# Altium schematic sheet Non_Prog_Logic.SchDoc
size A3; SheetNumber: 2; SheetTotal: 3
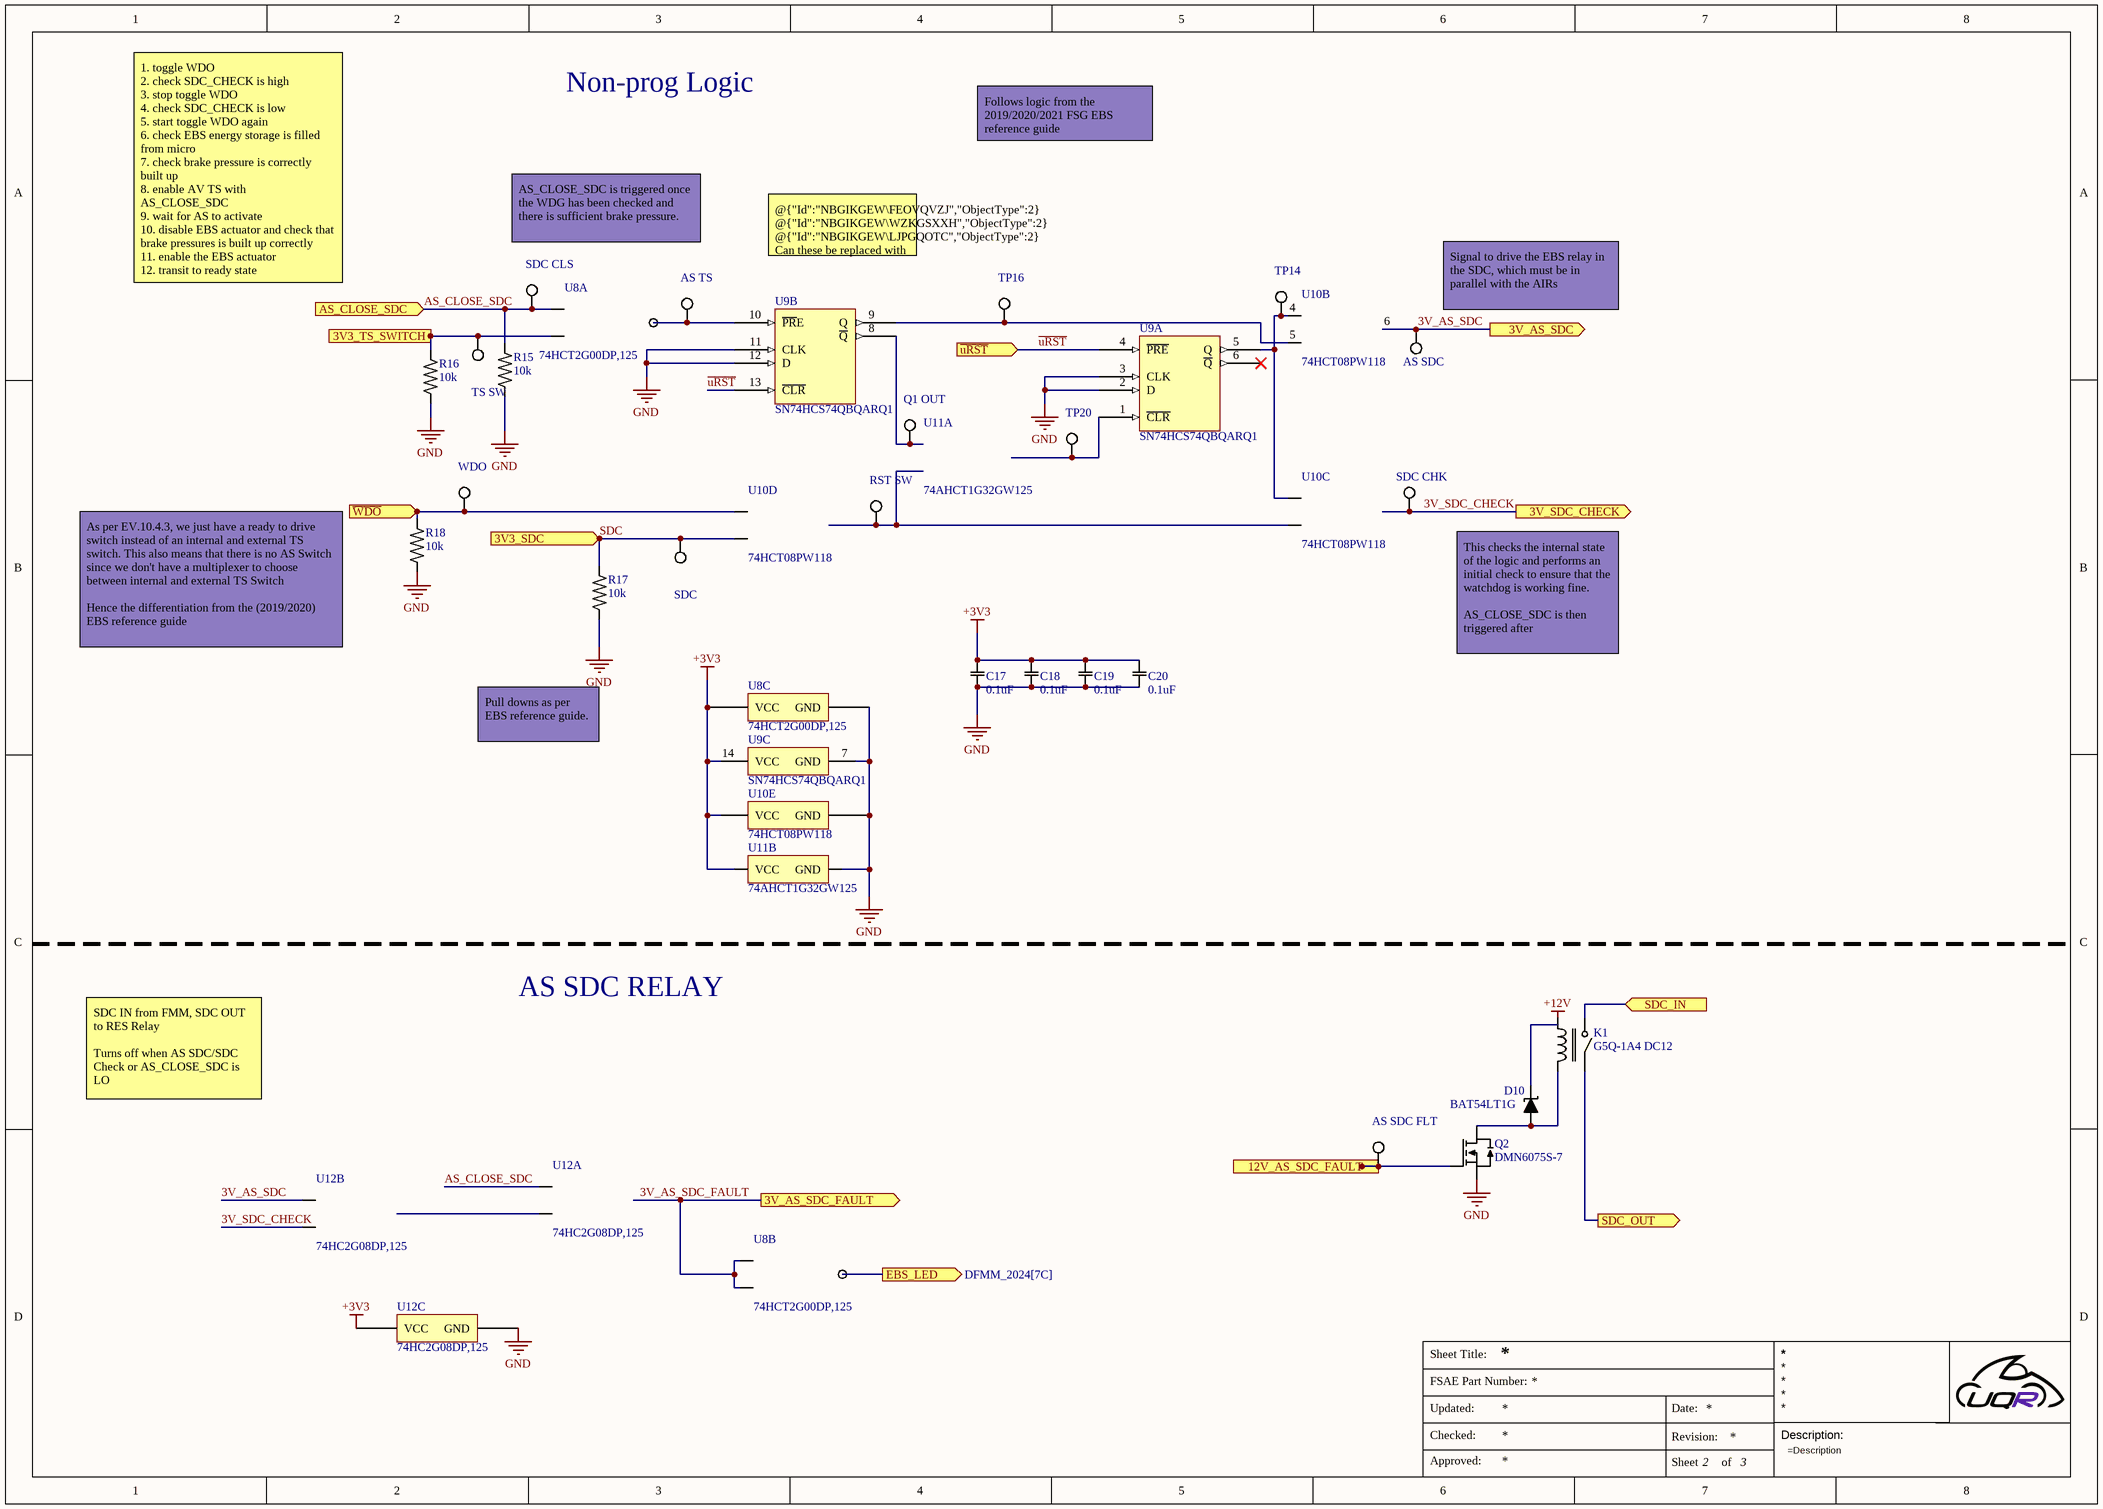
[diagram p0: Non_Prog_Logic.SchDoc]

## Parts
AS_SDC  5012  [KSTN-5012_V]  (value not drawn)
AS_SDC_FLT  5012  [KSTN-5012_V]  (value not drawn)
AS_TS  5012  [KSTN-5012_V]  (value not drawn)
C17  value 0.1uF  [CAPC1608X09M]  (hidden comment: CL10B104KB8NNWC)
C18  value 0.1uF  [CAPC1608X09M]  (hidden comment: CL10B104KB8NNWC)
C19  value 0.1uF  [CAPC1608X09M]  (hidden comment: CL10B104KB8NNWC)
C20  value 0.1uF  [CAPC1608X09M]  (hidden comment: CL10B104KB8NNWC)
D10  BAT54LT1G  [SOT95P237X111-3N]
K1  G5Q-1A4 DC12  [G5Q-1A4 DC12]
Q1_OUT  5012  [KSTN-5012_V]  (value not drawn)
Q2  DMN6075S-7  [SOT90P240X110-3N]
R15  value 10k  [RESC1608X06N]  (hidden comment: ESR03EZPJ103)
R16  value 10k  [RESC1608X06N]  (hidden comment: ESR03EZPJ103)
R17  value 10k  [RESC1608X06N]  (hidden comment: ESR03EZPJ103)
R18  value 10k  [RESC1608X06N]  (hidden comment: ESR03EZPJ103)
RST_SW  5012  [KSTN-5012_V]  (value not drawn)
SDC  5012  [KSTN-5012_V]  (value not drawn)
SDC_CHK  5012  [KSTN-5012_V]  (value not drawn)
SDC_CLS  5012  [KSTN-5012_V]  (value not drawn)
TP14  5012  [KSTN-5012_V]  (value not drawn)
TP16  5012  [KSTN-5012_V]  (value not drawn)
TP20  5012  [KSTN-5012_V]  (value not drawn)
TS_SW  5012  [KSTN-5012_V]  (value not drawn)
U8  74HCT2G00DP,125  [TSOP65P400X110-8N]  (parts A,B,C of 3)
U9  SN74HCS74QBQARQ1  [TSOP65P640X120-14N]  (parts A,B,C of 3)
U10  74HCT08PW118  [TSOP65P640X110-14N]  (parts B,C,D,E of 5)
U11  74AHCT1G32GW125  [TSOP65P210X110-6N]  (parts A,B of 2)
U12  74HC2G08DP,125  [TSOP65P490X108-8N]  (parts A,B,C of 3)
WDO  5012  [KSTN-5012_V]  (value not drawn)

## Ports
3V3_SDC (in, see DFMM_2024[7C], Microcontroller[3D]), 3V3_TS_SWITCH (in, see DFMM_2024[7B], Microcontroller[3D]), 3V_AS_SDC (out, see DFMM_2024[7B], Microcontroller[6A]), 3V_AS_SDC_FAULT (out, see DFMM_2024[7B], Microcontroller[1D]), 3V_SDC_CHECK (out, see DFMM_2024[7C], Microcontroller[6A]), 12V_AS_SDC_FAULT (in, see DFMM_2024[7B], Microcontroller[2D]), AS_CLOSE_SDC (in, see DFMM_2024[7B], Microcontroller[5B]), EBS_LED (out, see DFMM_2024[7C]), SDC_IN (in, see DFMM_2024[7C], Microcontroller[2D]), SDC_OUT (out, see DFMM_2024[7C]), ~{uRST} (in, see DFMM_2024[7B], Microcontroller[2A]), ~{WDO} (in, see DFMM_2024[7C], Microcontroller[2B])

## Nets
+3V3: C17.1 C18.1 C19.1 C20.1 U8.8(VCC) U9.14(VCC) U10.14(VCC) U11.5(VCC) U12.8(VCC)
+12V: D10.3(K)
GND: C17.2 C18.2 C19.2 C20.2 Q2.2(S) R15.2 R16.2 R17.2 R18.2 U8.4(GND) U9.2(D) U9.3(CLK) U9.7(GND) U9.11(CLK) U9.12(D) U10.7(GND) U11.3(GND) U12.4(GND)
3V3_TS_SWITCH: R16.1 TS_SW.1 U8.2(1B) ; port 3V3_TS_SWITCH
3V_AS_SDC: AS_SDC.1 U10.6(2Y) U12.5(2A) ; port 3V_AS_SDC
3V_AS_SDC_FAULT: U8.5(2A) U8.6(2B) U12.7(1Y) ; port 3V_AS_SDC_FAULT
3V_SDC_CHECK: SDC_CHK.1 U10.8(3Y) U12.6(2B) ; port 3V_SDC_CHECK
12V_AS_SDC_FAULT: AS_SDC_FLT.1 Q2.1(G) ; port 12V_AS_SDC_FAULT
~{uRST}: U9.4(~{PRE}) U9.13(~{CLR}) ; port ~{uRST}
~{WDO}: R18.1 U10.12(4A) WDO.1 ; port ~{WDO}
AS_CLOSE_SDC: R15.1 SDC_CLS.1 U8.1(1A) U12.1(1A) ; port AS_CLOSE_SDC
EBS_LED: U8.3(2Y) ; port EBS_LED
SDC: R17.1 SDC.1 U10.13(4B) ; port 3V3_SDC
SDC_IN: K1.3 ; port SDC_IN
SDC_OUT: K1.2 ; port SDC_OUT
NetAS_TS_1: AS_TS.1 U8.7(1Y) U9.10(~{PR}E)
NetD10_1: D10.1(A) K1.5 Q2.3(D)
NetQ1_OUT_1: Q1_OUT.1 U9.8(~{Q}) U11.2(A)
NetRST_SW_1: RST_SW.1 U10.10(3B) U10.11(4Y) U11.1(B)
NetTP14_1: TP14.1 U9.5(Q) U10.4(2A) U10.9(3A)
NetTP16_1: TP16.1 U9.9(Q) U10.5(2B)
NetTP20_1: TP20.1 U9.1(~{CLR}) U11.4(Y)
NetU12_2: U12.2(1B) U12.3(2Y)

Not connected (* = marked no-connect by the designer): K1 1; U9 6(~{Q})*

## Notes on the sheet
- Non-prog Logic
- Follows logic from the 2019/2020/2021 FSG EBS reference guide
- AS_CLOSE_SDC is triggered once the WDG has been checked and there is sufficient brake pressure.
- 1. toggle WDO
  2. check SDC_CHECK is high
  3. stop toggle WDO
  4. check SDC_CHECK is low
  5. start toggle WDO again
  6. check EBS energy storage is filled from micro
  7. check brake pressure is correctly built up
  8. enable AV TS with AS_CLOSE_SDC
  9. wait for AS to activate
  10. disable EBS actuator and check that brake pressures is built up correctly
  11. enable the EBS actuator
  12. transit to ready state
- @{"Id":"NBGIKGEW\FEOVQVZJ","ObjectType":2} @{"Id":"NBGIKGEW\WZKGSXXH","ObjectType":2} @{"Id":"NBGIKGEW\LJPGQOTC","ObjectType":2} Can these be replaced with latch?
- Signal to drive the EBS relay in the SDC, which must be in parallel with the AIRs
- As per EV.10.4.3, we just have a ready to drive switch instead of an internal and external TS switch. This also means that there is no AS Switch since we don't have a multiplexer to choose between internal and external TS Switch
  Hence the differentiation from the (2019/2020) EBS reference guide
- This checks the internal state of the logic and performs an initial check to ensure that the watchdog is working fine.
  AS_CLOSE_SDC is then triggered after
- Pull downs as per EBS reference guide.
- AS SDC RELAY
- SDC IN from FMM, SDC OUT to RES Relay
  Turns off when AS SDC/SDC Check or AS_CLOSE_SDC is LO
- Sheet Title:
- FSAE Part Number:
- Updated:
- Approved:
- Checked:
- Date:
- Revision:
- Description:
- Sheet
- of

## Library data of the parts
AS_SDC AS_SDC_FLT AS_TS Q1_OUT RST_SW SDC SDC_CHK SDC_CLS TP14 TP16 TP20 TS_SW WDO = CMP-008-000006-1: PC TEST POINT MULTIPURPOSE WHITE; Manufacturer: Keystone Electronics; SPN: 36-5012-ND; Supplier: Digi=Key; MPN: 5012; Link: https://www.digikey.com.au/en/products/detail/keystone-electronics/5012/255334
C17-C20 = CMP-001-00001-2: CAP CER 0.1UF 50V X7R 0603; Manufacturer: Samsung Electro-Mechanics; SPN: 1276-1935-1-ND; Link: https://www.digikey.com.au/en/products/detail/samsung-electro-mechanics/CL10B104KB8NNWC/3887593; Supplier: Digi-Key; MPN: CL10B104KB8NNWC
D10 = CMP-00025-2: DIODE SCHOTTKY 30V 200MA SOT23-3; Manufacturer: onsemi; SPN: BAT54LT1GOSCT-ND; Link: https://www.digikey.com.au/en/products/detail/onsemi/BAT54LT1G/918316; Supplier: Digi-Key; MPN: BAT54LT1G
K1 = CMP-00027-3: RELAY GEN PURPOSE SPST 10A 12V; Manufacturer: Omron Electronics Inc-EMC Div; SPN: Z223-ND; MPN: G5Q-1A4 DC12; Supplier: Digi-Key; Link: https://www.digikey.com.au/en/products/detail/omron-electronics-inc-emc-div/G5Q-1A4-DC12/355241
Q2 = CMP-00028-1: MOSFET N-CH 60V 2A SOT23; Manufacturer: Diodes Incorporated; SPN: DMN6075S-7DICT-ND; MPN: DMN6075S-7; Supplier: Digi-Key; Link: https://www.digikey.com.au/en/products/detail/diodes-incorporated/DMN6075S-7/5149292
R15-R18 = CMP-00017-5: RES SMD 10K OHM 5% 1/4W 0603; Manufacturer: Rohm Semiconductor; SPN: RHM10KDCT-ND; Supplier: Digi-Key; Link: https://www.digikey.com.au/en/products/detail/rohm-semiconductor/ESR03EZPJ103/1762722; MPN: ESR03EZPJ103
U8 = CMP-00011-2: IC GATE NAND 2CH 2-INP 8-TSSOP; Manufacturer: Nexperia; SPN: 771-HCT2G00DP125; MPN: 74HCT2G00DP,125; Link: https://au.mouser.com/ProductDetail/Nexperia/74HCT2G00DP125?qs=P62ublwmbi9XudN5AZ1K2A%3D%3D; Supplier: Mouser
U9 = CMP-00012-7: Automotive Schmitt-trigger input dual D-type positive-edge-triggered flip-flops w/ clear and preset 14-WQFN -40 to 125; Manufacturer: Texas Instruments; SPN: 595-SN74HCS74QBQARQ1; Link: https://au.mouser.com/ProductDetail/Texas-Instruments/SN74HCS74QBQARQ1?qs=iLbezkQI%252BsjKprXS%252BnKw7A%3D%3D; Supplier: Mouser; MPN: SN74HCS74QBQARQ1
U10 = CMP-00037-2: NXP         74HCT08PW,118            AND Gate, HCT Family, 2 Input, 4 Gate, 4.5V to 5.5V, TSSOP-14; Manufacturer: Nexperia; SPN: 771-HCT08PW118; MPN: 74HCT08PW,118; Link: https://au.mouser.com/ProductDetail/Nexperia/74HCT08PW118?qs=P62ublwmbi%252B841Sqd09uyw%3D%3D; Supplier: Mouser
U11 = CMP-00038-2: IC GATE OR 1CH 2-INP 5-TSSOP; MPN: 74AHCT1G32GW,125; Manufacturer: Nexperia; SPN: 771-74AHCT1G32GW-G; Supplier: Mouser; Link: https://au.mouser.com/ProductDetail/Nexperia/74AHCT1G32GW125?qs=P62ublwmbi%252BVV1rPKRAsIA%3D%3D
U12 = CMP-00013-6: IC GATE AND 2CH 2-INP 8-TSSOP; Manufacturer: Nexperia; SPN: 771-HC2G08DP125; MPN: 74HC2G08DP,125; Supplier: Mouser; Link: https://au.mouser.com/ProductDetail/Nexperia/74HC2G08DP125?qs=P62ublwmbi%2F9zKgKimyHlg%3D%3D; PartId: 1